# Altium project PI5.extension.board.001.PrjPcb
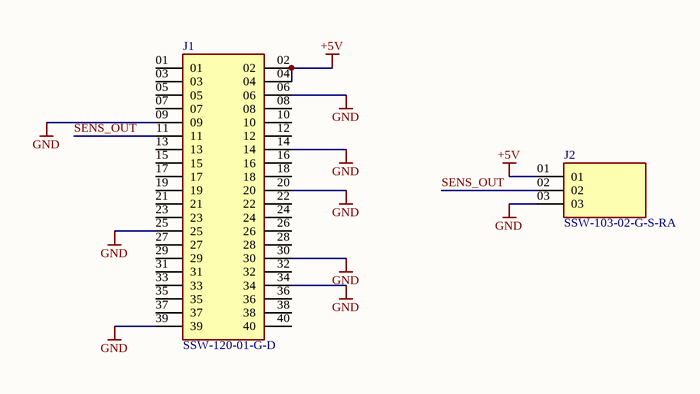
[diagram p0: PI5_extension_board_001.SchDoc]
1 sheet, 2 parts. Net scope: global (net labels, ports and power ports of the same name join across sheets).
Board file: PI5_extension_board_001.PcbDoc

## Sheet PI5_extension_board_001.SchDoc
size A4; SheetNumber: 1; SheetTotal: 1

### Parts
J1  SSW-120-01-G-D  [SAMTEC_SSW-120-01-G-D]
J2  SSW-103-02-G-S-RA  [SAMTEC_SSW-103-02-G-S-RA]

### Nets
+5V: J1.02 J1.04 J2.01
GND: J1.06 J1.09 J1.14 J1.20 J1.25 J1.30 J1.34 J1.39 J2.03
SENS_OUT: J1.11 J2.02

Not connected (* = marked no-connect by the designer): J1 01 03 05 07 08 10 12 13 15 16 17 18 19 21 22 23 24 26 27 28 29 31 32 33 35 36 37 38 40

### Library data of the parts
J1 = SSW-120-01-G-D: MF: Samtec; Package: None; Availability: Unavailable; Value: *; MP: SSW-120-01-G-D; Price: None
J2 = SSW-103-02-G-S-RA: MF: Samtec Inc.; Availability: Unavailable; Price: None; Package: None; Value: *; MP: SSW-103-02-G-S-RA